# Altium project IoT-Speaker-v2.0.PrjPcb (part 3 of 3)
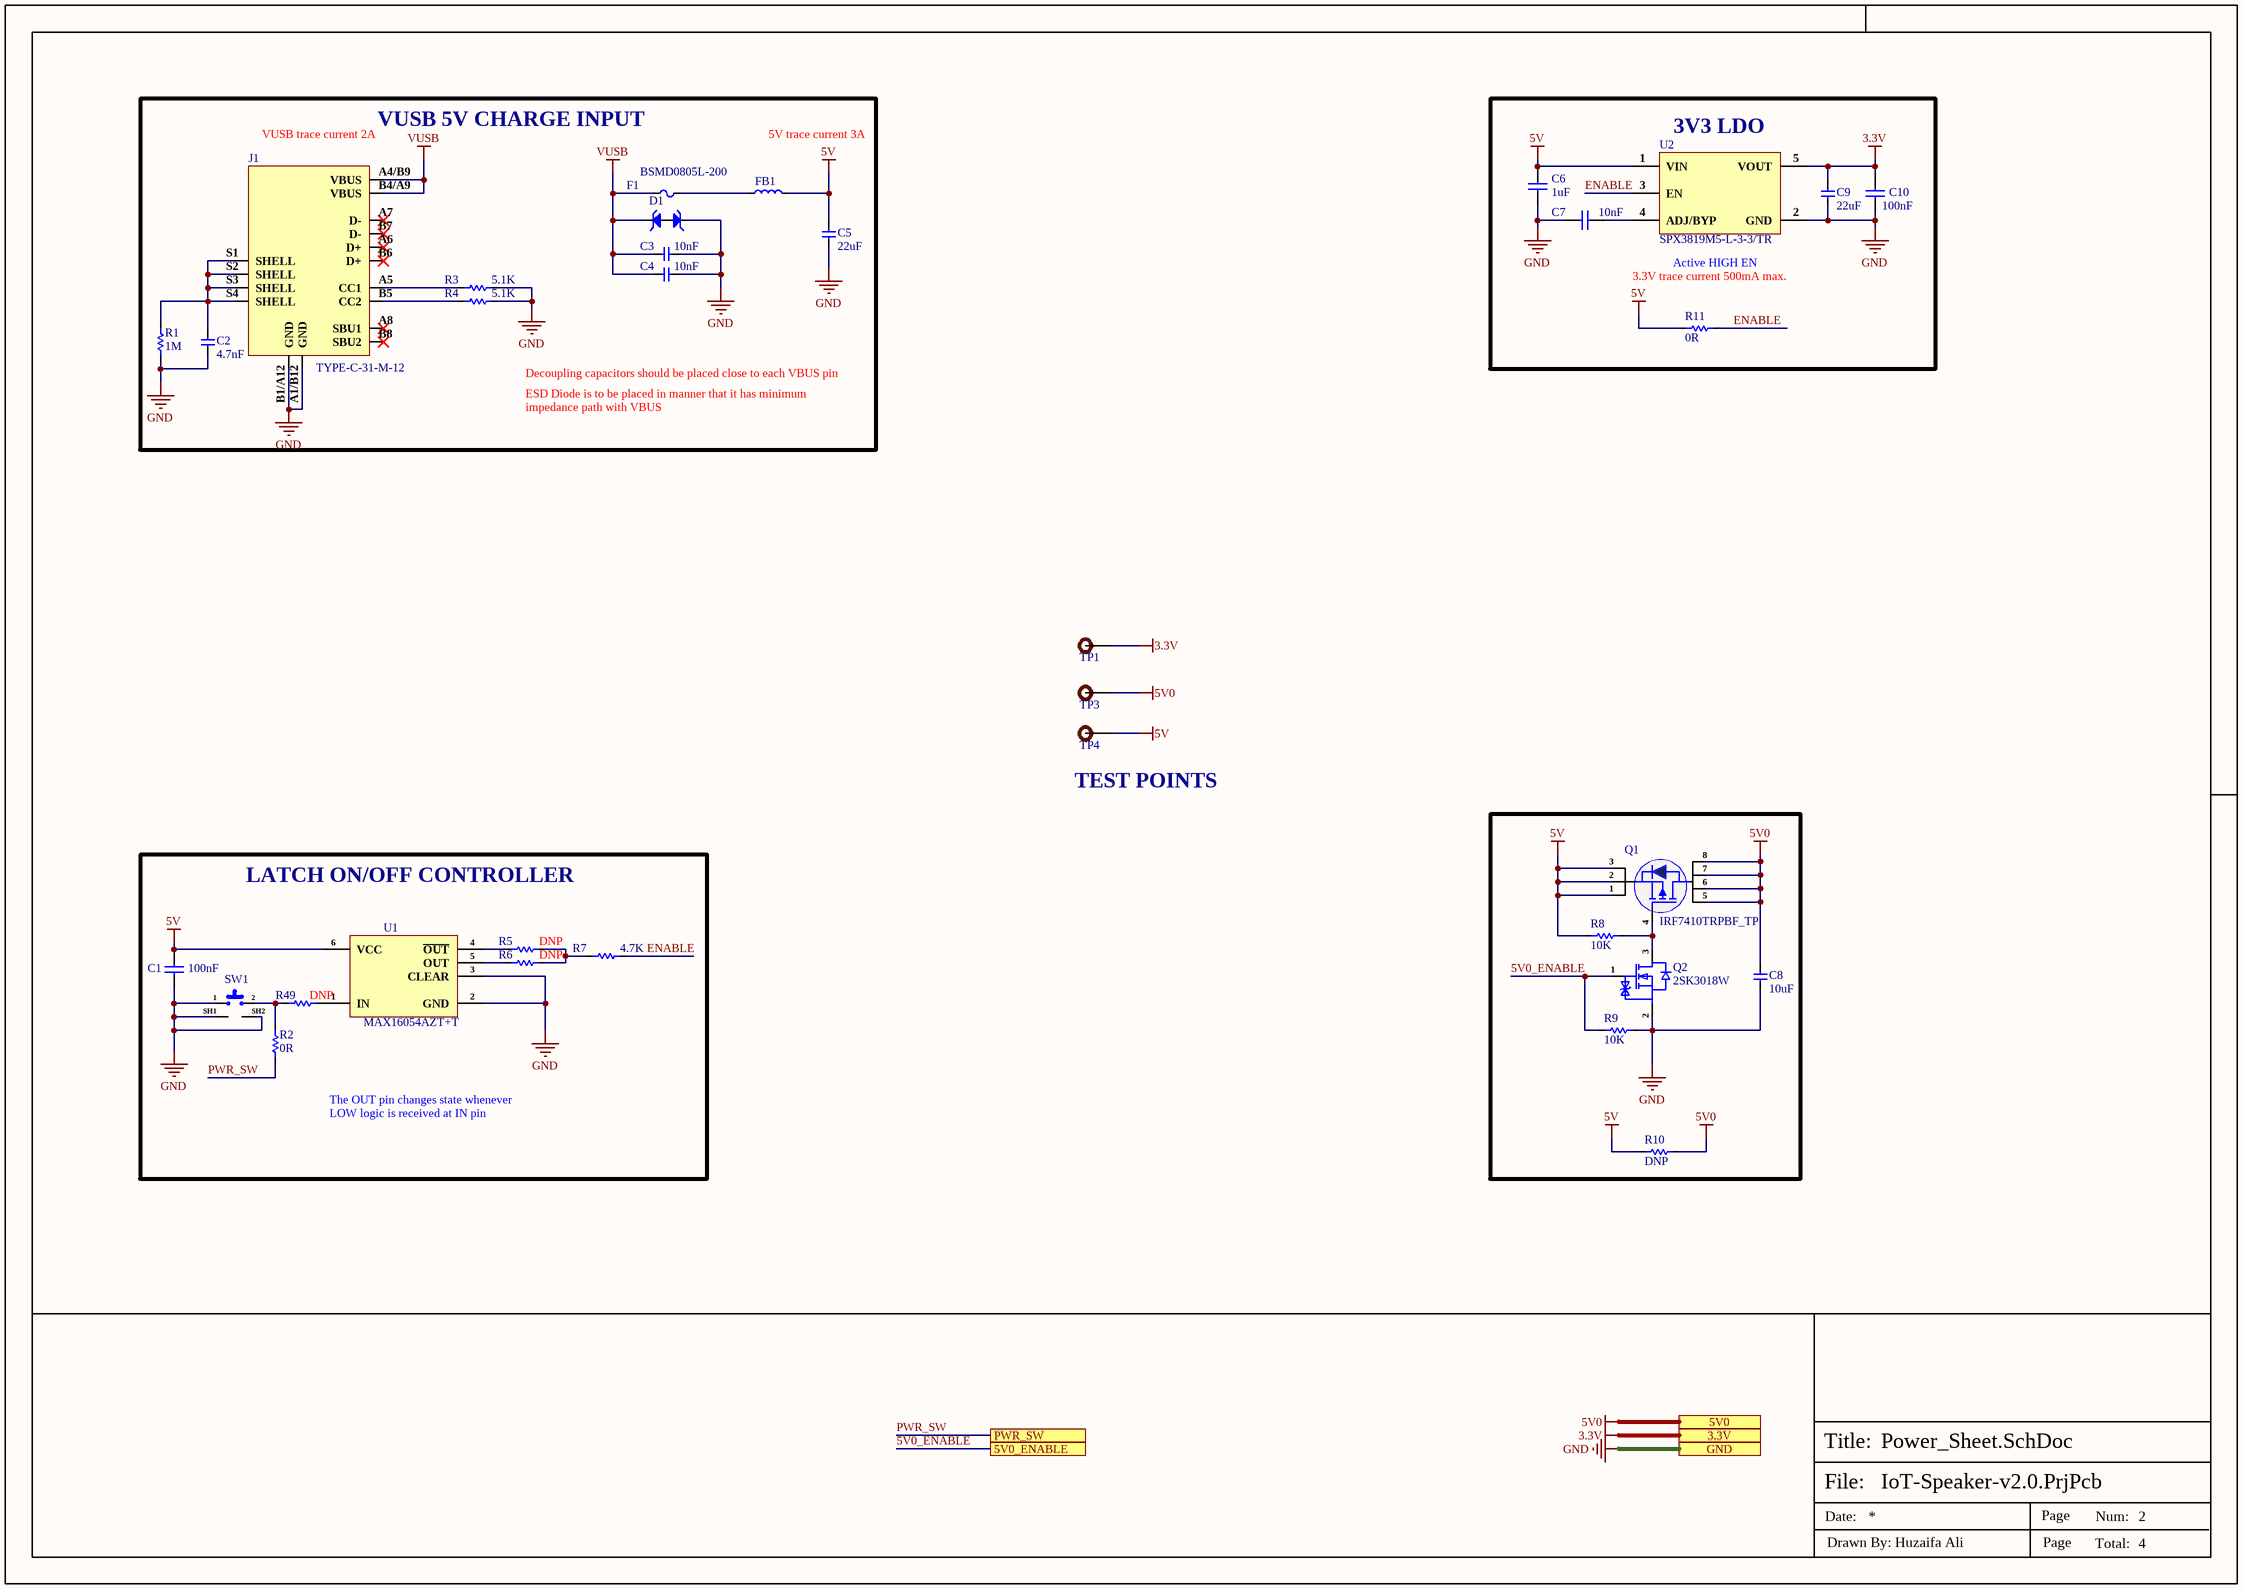
[diagram p4: Power_Sheet.SchDoc]

## Nets that join several sheets
3.3V: Audio_Amplifier (FB2.2), Controller_Sheet (12 pins), Power_Sheet (C9.2 C10.2 TP1.1 U2.5)
5V0: Audio_Amplifier (FB3.2), Controller_Sheet (LED1.1 LED2.1 LED3.1 R19.2), Power_Sheet (7 pins)
GND: Audio_Amplifier (R41.2 R45.1 R46.1), Controller_Sheet (39 pins), Power_Sheet (24 pins)
5V0_ENABLE: Controller_Sheet (U3.36), Power_Sheet (Q2.1 R9.2)
AMP_CTRL: Audio_Amplifier (R40.1), Controller_Sheet (U3.9)
BCLK: Audio_Amplifier (U4.1), Controller_Sheet (U3.12)
CLKIN: Audio_Amplifier (U4.3), Controller_Sheet (R21.2)
DATA_IN: Audio_Amplifier (U4.12), Controller_Sheet (U3.10)
LRCLK: Audio_Amplifier (U4.2), Controller_Sheet (U3.11)
PWR_SW: Controller_Sheet (R17.1 U3.26), Power_Sheet (R2.1)